# EAGLE design board (EAGLE 9.7.0)
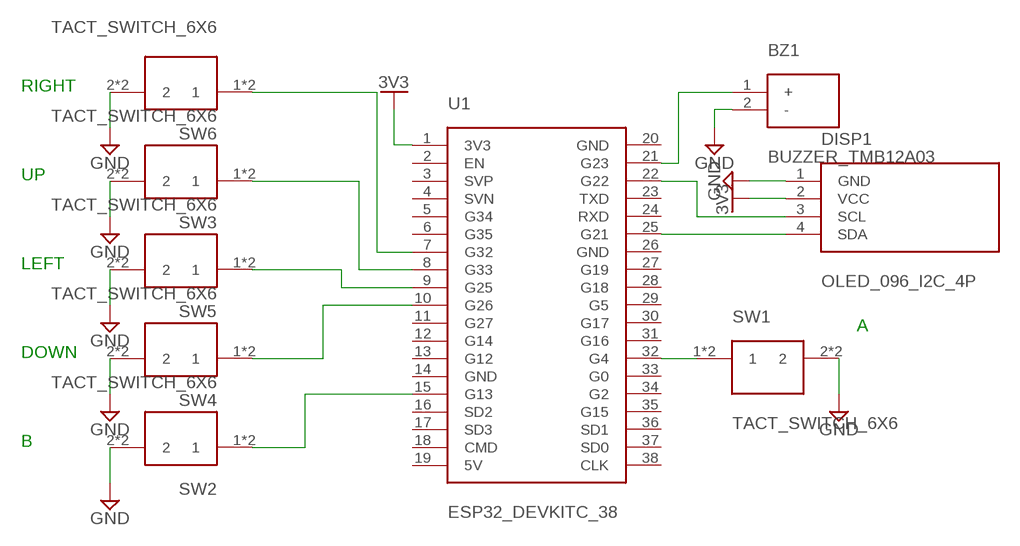
[diagram p0: schematic, sheet 1]

## Parts
BZ1  BUZZER_TMB12A03  [BUZZER_TMB12A03]
DISP1  OLED_096_I2C_4P  [OLED_096_I2C_4P]
SW1  TACT_SWITCH_6X6  [TACT_SWITCH_6X6]
SW2  TACT_SWITCH_6X6  [TACT_SWITCH_6X6]
SW3  TACT_SWITCH_6X6  [TACT_SWITCH_6X6]
SW4  TACT_SWITCH_6X6  [TACT_SWITCH_6X6]
SW5  TACT_SWITCH_6X6  [TACT_SWITCH_6X6]
SW6  TACT_SWITCH_6X6  [TACT_SWITCH_6X6]
U1  ESP32_DEVKITC_38  [ESP32_DEVKITC_38]

## Nets
3V3: DISP1.2(VCC) U1.1(3V3)
BTN_A: SW1.1 SW1.3 U1.32(G4)
BTN_B: SW2.1 SW2.3 U1.15(G13)
BTN_DOWN: SW4.1 SW4.3 U1.10(G26)
BTN_LEFT: SW5.1 SW5.3 U1.9(G25)
BTN_RIGHT: SW6.1 SW6.3 U1.7(G32)
BTN_UP: SW3.1 SW3.3 U1.8(G33)
BUZZER: BZ1.1(+) U1.21(G23)
GND: BZ1.2(-) DISP1.1(GND) SW1.2 SW1.4 SW2.2 SW2.4 SW3.2 SW3.4 SW4.2 SW4.4 SW5.2 SW5.4 SW6.2 SW6.4
SCL: DISP1.3(SCL) U1.22(G22)
SDA: DISP1.4(SDA) U1.25(G21)
Unconnected: U1.2(EN) U1.3(SVP) U1.4(SVN) U1.5(G34) U1.6(G35) U1.11(G27) U1.12(G14) U1.13(G12) U1.16(SD2) U1.17(SD3) U1.18(CMD) U1.19(5V) U1.23(TXD) U1.24(RXD) U1.27(G19) U1.28(G18) U1.29(G5) U1.30(G17) U1.31(G16) U1.33(G0) U1.34(G2) U1.35(G15) U1.36(SD1) U1.37(SD0) U1.38(CLK)

## Notes on the sheet
- RIGHT
- UP
- LEFT
- A
- DOWN
- B

## Power pins joined to a net without a drawn wire
GND: U1.14(GND) U1.20(GND) U1.26(GND)

## Library data of the parts
BZ1 = buzzer_tmb12a03:BUZZER_TMB12A03: Active buzzer TMB12A03, 3 V, 12 mm. Active magnetic buzzer: it has its own oscillator, so plain DC on its legs gives a steady tone of about 2.3 to 2.4 kHz (no PWM needed). Rated 3 V. The + leg is marked on the body and the seal sticker. The seal keeps flux out during washing: peel it off after soldering, or the buzzer stays quiet. Store location: kit.; LOCATION: kit
DISP1 = oled_096_i2c:OLED_096_I2C_4P: OLED display 0.96 inch, 128 x 64, I2C (4 pins). Monochrome OLED module with a 4-pin I2C header (GND, VCC, SCL, SDA), four corner mounting holes, the glass panel's flex cable folded behind the board. Most modules like this use the SSD1306 controller at I2C address 0x3C; the controller on this one is not read yet. Store location: kit.; LOCATION: kit
SW1-SW6 = tact_switch_6x6:TACT_SWITCH_6X6: Tactile push button 6 x 6 mm, through-hole, 4 legs. Momentary push button: pressing it connects its two contacts, letting go opens them. Four legs in a 6.5 x 4.5 mm rectangle; each leg is joined inside to the leg straight across the body (6.5 mm), and the two legs on the same side (4.5 mm) are the switch. On an ESP32: one contact to a GPIO, the other to GND, with the pin's internal pull-up on (pressed reads 0). Store location: kit.; LOCATION: kit
U1 = esp32_devkitc_38:ESP32_DEVKITC_38: ESP32 DevKitC, 38 pins (clone). ESP32 development board: ESP-WROOM-32 module, CP2102 USB-to-serial, micro-USB, 3.3 V regulator, RST and BOOT buttons. Pin order equal to Espressif's ESP32-DevKitC V4. Store location: kit.; LOCATION: kit

## Board
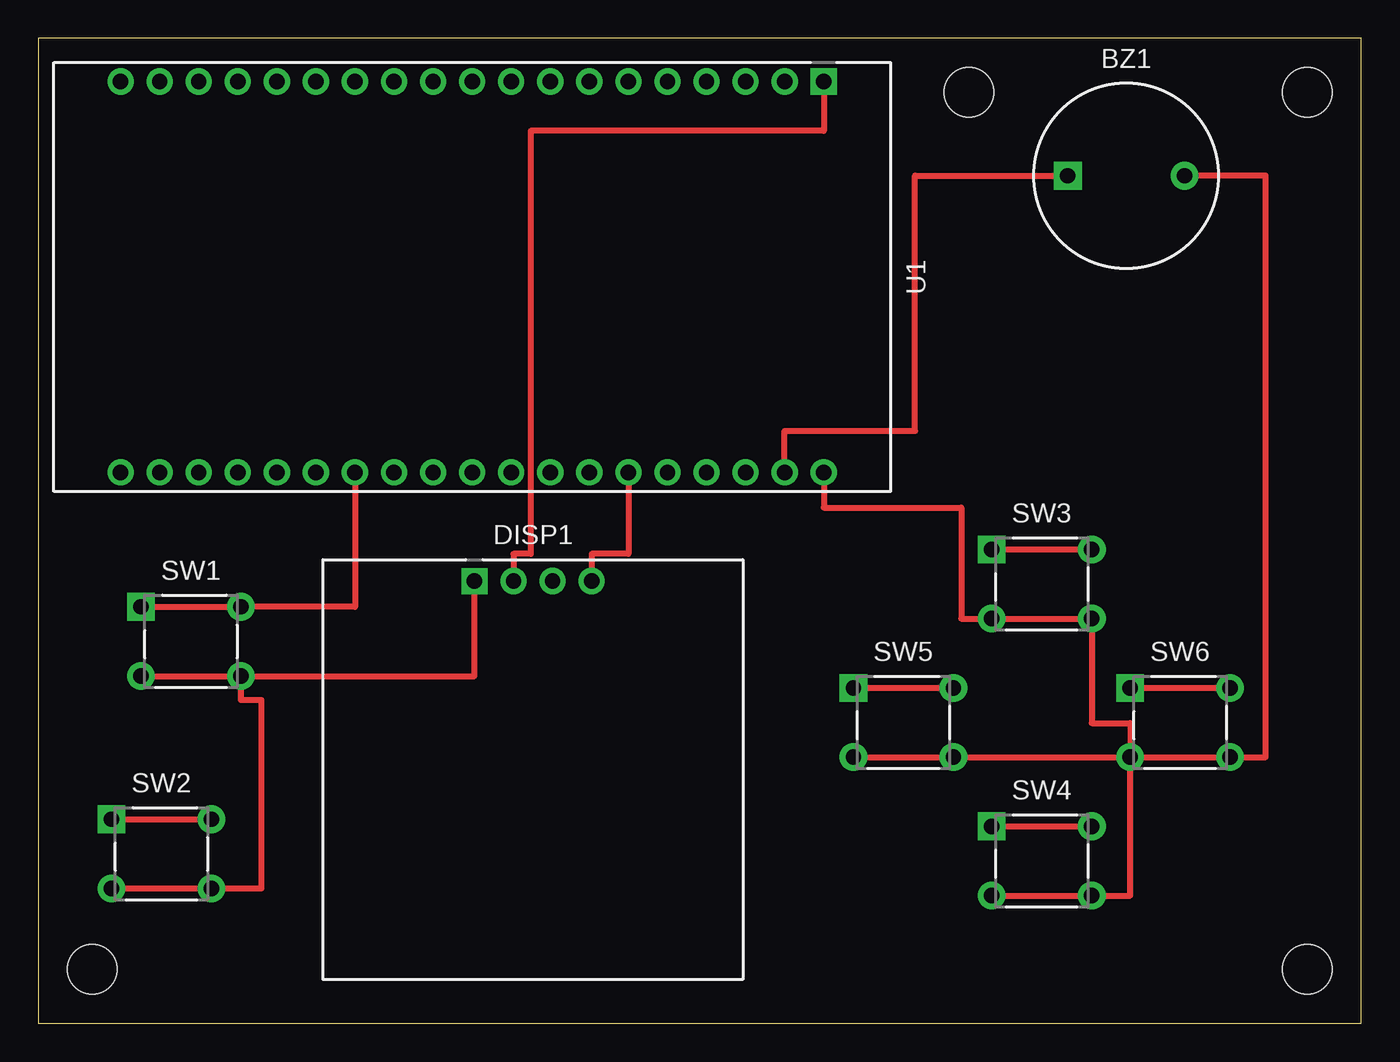
[diagram p1: board, top side]
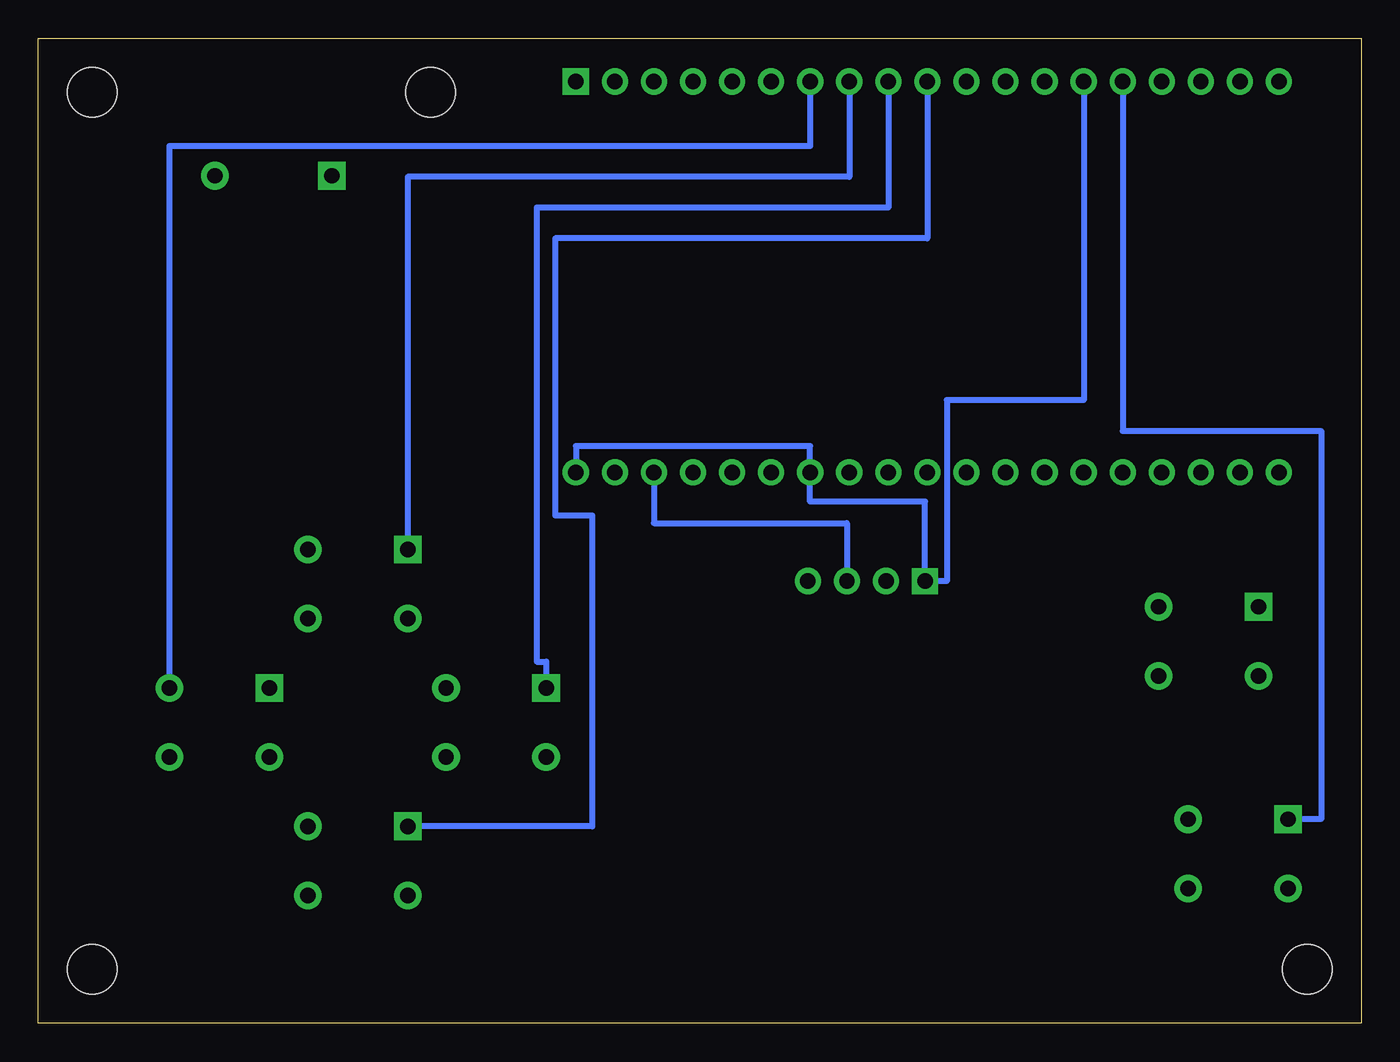
[diagram p2: board, bottom side, seen from below]

Size 86 x 64 mm. Coordinates in mm from the lower left corner, seen from the top.
Outline: 0,0 86,0 86,64 0,64 0,0
Copper layers (1*16): Top 0.035mm / dielectric 1.5mm / Bottom 0.035mm
Design rules "Fusion Electronics Design Rules": minimum track width 6mil, minimum drill 0.35mm, track to track 6mil, track to pad 6mil, pad to pad 6mil, via to via 6mil, smd to smd 6mil, copper to edge 40mil, drill to drill 6mil, minimum pad ring 10mil, minimum via ring 8mil, stop-mask expansion 4mil, vias tented up to drill 32mil, thermal gap 10mil
Holes 3.2 mm at 3.5,3.5 82.5,3.5 82.5,60.5 60.5,60.5

### Footprints (pad centres in the part's own frame; a part is rotated, then mirrored left to right if it is on the bottom)
BUZZER_TMB12A03 = drill 1 pad 1.8 square: 1 -3.8,0 | drill 1 pad 1.8: 2 3.8,0
OLED_096_I2C_4P = drill 1 pad 1.7 square: 1 -3.81,0 | drill 1 pad 1.7: 2 -1.27,0; 3 1.27,0; 4 3.81,0
TACT_SWITCH_6X6 = drill 1 pad 1.8 square: 1 -3.25,2.25 | drill 1 pad 1.8: 2 -3.25,-2.25; 3 3.25,2.25; 4 3.25,-2.25
ESP32_DEVKITC_38 = drill 1 pad 1.7 square: 1 -12.7,22.86 | drill 1 pad 1.7: 2 -12.7,20.32; 3 -12.7,17.78; 4 -12.7,15.24; 5 -12.7,12.7; 6 -12.7,10.16; 7 -12.7,7.62; 8 -12.7,5.08; 9 -12.7,2.54; 10 -12.7,0; 11 -12.7,-2.54; 12 -12.7,-5.08; 13 -12.7,-7.62; 14 -12.7,-10.16; 15 -12.7,-12.7; 16 -12.7,-15.24; 17 -12.7,-17.78; 18 -12.7,-20.32; 19 -12.7,-22.86; 20 12.7,22.86; 21 12.7,20.32; 22 12.7,17.78; 23 12.7,15.24; 24 12.7,12.7; 25 12.7,10.16; 26 12.7,7.62; 27 12.7,5.08; 28 12.7,2.54; 29 12.7,0; 30 12.7,-2.54; 31 12.7,-5.08; 32 12.7,-7.62; 33 12.7,-10.16; 34 12.7,-12.7; 35 12.7,-15.24; 36 12.7,-17.78; 37 12.7,-20.32; 38 12.7,-22.86

### Placement (x,y rotation side)
BZ1  70.73,55.08 0 top
DISP1  32.16,28.73 0 top
SW1  9.92,24.81 0 top
SW2  8,11 0 top
SW3  65.24,28.54 0 top
SW4  65.24,10.54 0 top
SW5  56.24,19.54 0 top
SW6  74.24,19.54 0 top
U1  28.2,48.5 270 top

### Tracks (layer width: path | path; a pad name or v marks a point on that pad's centre or on a via)
3V3
  Top 0.4: U1.1 51.06,58 32.01,58 32.01,30.5 30.89,30.5 DISP1.2
BTN_A
  Top 0.4: U1.32 20.58,27.06 SW1.3 SW1.1
BTN_B
  Top 0.4: SW2.1 SW2.3
  Bottom 0.4: U1.15 15.5,38.5 2.6,38.5 2.6,13.25 SW2.1
BTN_DOWN
  Top 0.4: SW4.1 SW4.3
  Bottom 0.4: U1.10 28.2,51 52.4,51 52.4,33 50,33 50,12.79 SW4.1
BTN_LEFT
  Top 0.4: SW5.1 SW5.3
  Bottom 0.4: U1.9 30.74,53 53.6,53 53.6,23.5 52.99,23.5 SW5.1
BTN_RIGHT
  Top 0.4: SW6.1 SW6.3
  Bottom 0.4: U1.7 35.82,57 77.49,57 SW6.3
BTN_UP
  Top 0.4: SW3.1 SW3.3
  Bottom 0.4: U1.8 33.28,55 61.99,55 SW3.1
BUZZER
  Top 0.4: U1.21 48.52,38.5 57,38.5 57,55.08 BZ1.1
GND
  Top 0.4: SW1.2 SW1.4 | SW2.2 SW2.4 14.5,8.75 14.5,21 13.17,21 SW1.4 | SW4.2 SW4.4 70.99,8.29 SW6.2 | SW5.2 SW5.4 SW6.2 | SW6.2 SW6.4 79.8,17.29 79.8,55.08 BZ1.2 | SW1.4 28.35,22.56 DISP1.1 | U1.20 51.06,33.5 60,33.5 60,26.29 SW3.2 SW3.4 68.49,19.5 70.99,19.5 SW6.2
  Bottom 0.4: U1.14 18.04,40.5 26.93,40.5 26.93,28.73 DISP1.1 28.35,33.9 35.82,33.9 U1.26 35.82,37.5 51.06,37.5 U1.20
SCL
  Bottom 0.4: U1.22 45.98,32.5 33.43,32.5 DISP1.3
SDA
  Top 0.4: U1.25 38.36,30.5 35.97,30.5 DISP1.4